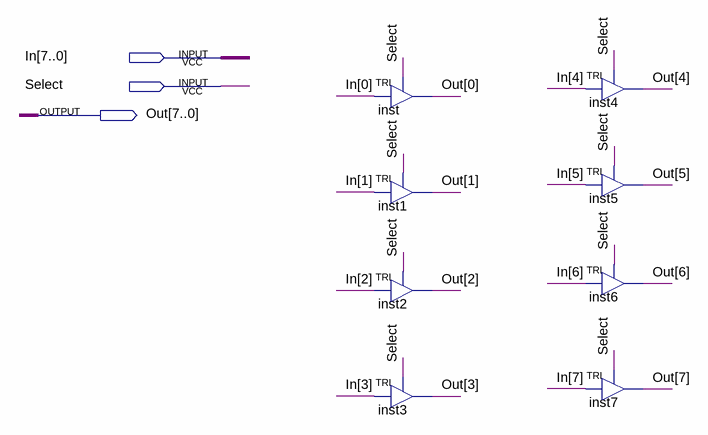
[diagram p0: schematic sheet]
// Quartus schematic 8bit-TriState.bdf as structural Verilog: 8 symbols, 3 pins
module \8bit-TriState  (
  input  [7:0] In,
  input  Select,
  output [7:0] Out
);

  TRI inst (.IN(In[0]), .OE(Select), .OUT(Out[0]));
  TRI inst1 (.IN(In[1]), .OE(Select), .OUT(Out[1]));
  TRI inst2 (.IN(In[2]), .OE(Select), .OUT(Out[2]));
  TRI inst3 (.IN(In[3]), .OE(Select), .OUT(Out[3]));
  TRI inst4 (.IN(In[4]), .OE(Select), .OUT(Out[4]));
  TRI inst5 (.IN(In[5]), .OE(Select), .OUT(Out[5]));
  TRI inst6 (.IN(In[6]), .OE(Select), .OUT(Out[6]));
  TRI inst7 (.IN(In[7]), .OE(Select), .OUT(Out[7]));
endmodule
